# Altium project TRS-Debug.PrjPcb
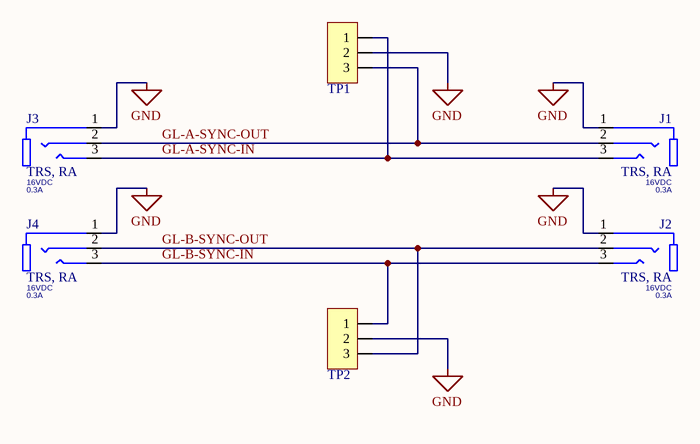
[diagram p0: TRS-Debug_TOP.SchDoc]
ProjINPP: 232; ProjTitle: Tip-Ring-Sleeve Pass Through; ProjRevision: v1.0; ProjOrganization2: INPP 232; ProjOrganization1: University of Virginia; ProjEngineer: S. Goadhouse; ProjAddress1: Charlottesville, VA. USA
1 sheet, 6 parts. Net scope: hierarchical (ports join the sheet entries above them; power ports are global).
Board file: TRS-Debug.PcbDoc

## Sheet TRS-Debug_TOP.SchDoc: Top Sheet
size A3; Engineer: S.Goadhouse; Organization1: University of Virginia; Address1: Charlottesville, VA, USA; Address2: Charlottesville, VA, USA; Revision: v1_0_0; Organization2: University of Virginia; SPICEModelCacheULYULKGY: <root> / <DocumentId>ULYULKGY</DocumentId> / </root>

### Parts
J1  TRS, RA  Current: 0.3A  Voltage: 16VDC  [TH-CONN3A-TRS]
J2  TRS, RA  Current: 0.3A  Voltage: 16VDC  [TH-CONN3A-TRS]
J3  TRS, RA  Current: 0.3A  Voltage: 16VDC  [TH-CONN3A-TRS]
J4  TRS, RA  Current: 0.3A  Voltage: 16VDC  [TH-CONN3A-TRS]
TP1  DIFFPROBE  [DIFFPROBE-2MM]  (value not drawn)  (no BOM)
TP2  DIFFPROBE  [DIFFPROBE-2MM]  (value not drawn)  (no BOM)

### Nets
GND: J1.1 J2.1 J3.1 J4.1 TP1.2 TP2.2
GL-A-SYNC-IN: J1.3 J3.3 TP1.1
GL-A-SYNC-OUT: J1.2 J3.2 TP1.3
GL-B-SYNC-IN: J2.3 J4.3 TP2.1
GL-B-SYNC-OUT: J2.2 J4.2 TP2.3

### Notes on the sheet
- Description
- Title
- Size:
- Revision:
- A3
- Designed by:
- Date:
- Sheet
- of
- File:

### Library data of the parts
J1-J4 = 6112-0066: 3.50mm (0.141, 1/8, Mini Plug) - Headphone Phone Jack Stereo (3 Conductor, TRS) Connector Kinked Pin; Part Description: CONN, TH, TRS, 3.5 MM, 3 PINS, RT ANG; Manufacturer 1: KYCON; Manufacturer Comp Height 1: 5.5mm; Class: TRS\TH; PressFit: No; DeviceID: 6112-0066; Value: TRS, RA; Case: TH; SMD: No; Component Kind: Standard; Component Type: Standard; Pin Count: 3; HelpURL: https://www.kycon.com/Pub_Eng_Draw/STX-3000.pdf; Supplier 1: Digi-Key; Supplier Part Number 1: 2092-STX-3000-ND; Manufacturer Part Number 1: STX-3000
TP1 TP2 = DIFFPROBE: Differential Test Probe; Note: NOT A PART